# Altium schematic sheet ESP32.SchDoc: ESP32
size A4; Date: 12/11/2026; Author: LuiS David Duque Cañas; SheetNumber: 3; SheetTotal: 3
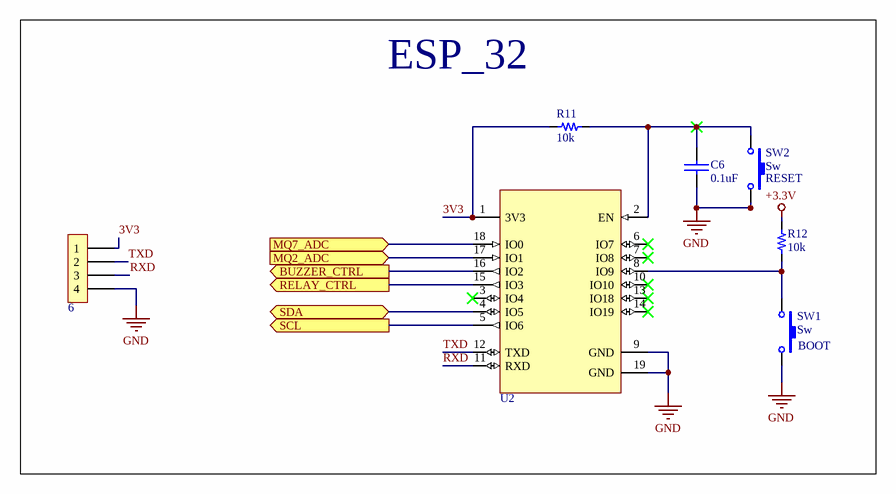
[diagram p0: ESP32.SchDoc]

## Parts
6  4x1  [H_4x1_TH_2.54mm]  (value not drawn)  (no BOM)
C6  value 0.1uF  [0603_cap]  (hidden comment: 0.1uF 50V)
R11  value 10k  [0603_res]  (hidden comment: 10k 1/10W)
R12  value 10k  [0603_res]  (hidden comment: 10k 1/10W)
SW1  Sw  [Sw_PUSH_4.5x4.5x5mm]
SW2  Sw  [Sw_PUSH_4.5x4.5x5mm]
U2  ESP32-C3-WROOM-02-N4  [ESP32-C3-WROOM-02-N4]  (value not drawn)

## Ports
BUZZER_CTRL (out, see Main[2B], Air-Quality[3B]), MQ2_ADC (in, see Main[2B], Air-Quality[2C]), MQ7_ADC (in, see Main[2B], Air-Quality[1C]), RELAY_CTRL (out, see Main[2C], Air-Quality[4C]), SCL (out, see Main[2B], Air-Quality[3D]), SDA (bidir, see Main[2B], Air-Quality[3D])

## Nets
+3.3V: R12.2
GND: 6.4 C6.2 SW1.2 SW2.2 U2.9(GND) U2.19(GND)
3V3: 6.1 R11.1 U2.1(3V3)
BUZZER_CTRL: U2.16(IO2) ; port BUZZER_CTRL
MQ2_ADC: U2.17(IO1) ; port MQ2_ADC
MQ7_ADC: U2.18(IO0) ; port MQ7_ADC
RELAY_CTRL: U2.15(IO3) ; port RELAY_CTRL
RXD: 6.3 U2.11(RXD)
SCL: U2.5(IO6) ; port SCL
SDA: U2.4(IO5) ; port SDA
TXD: 6.2 U2.12(TXD)
NetC6_1: C6.1 R11.2 SW2.1 U2.2(EN)
NetR12_1: R12.1 SW1.1 U2.8(IO9)

Not connected (* = marked no-connect by the designer): U2 3(IO4)* 6(IO7)* 7(IO8)* 10(IO10)* 13(IO18)* 14(IO19)*

## Notes on the sheet
- ESP_32
- (near SW2) RESET
- (near SW1) BOOT

## Library data of the parts
6 = H_Male_4x1_TH_100mil: ComponentLink1Description: LCSC
C6 = Cap_0.1uF_0603_50V: 50V 100nF Y5V -20%~+80% 0603 Multilayer Ceramic Capacitors MLCC - SMD/SMT ROHS; Manufacturer: Walsin Tech Corp; Manufacturer Part Number: 0603F104Z500CT; Supplier 1: LCSC; Supplier Part Number 1: C83060; ComponentLink1Description: LCSC; ComponentLink1URL: https://www.lcsc.com/product-detail/Multilayer-Ceramic-Capacitors-MLCC-SMD-SMT_Walsin-Tech-Corp-0603F104Z500CT_C83060.html
R11 R12 = Res_10k_0603_1/10W: RES SMD 10k OHM 5% 1/10W 0603; Manufacturer: FOJAN; Manufacturer Part Number: FRC0603J103TS; ComponentLink1URL: https://www.lcsc.com/product-detail/Chip-Resistor-Surface-Mount_FOJAN-FRC0603J103TS_C2930027.html; Supplier 1: LCSC; Supplier Part Number 1: C2930027; ComponentLink1Description: LCSC
SW1 SW2 = Sw_PUSH_4.5x4.5x5.0xmm: SWITCH TACTILE SPST-NO 0.05A 12V; Manufacturer: BZCN; Manufacturer Part Number: TSC015A05026A; Supplier 1: LCSC; Supplier Part Number 1: C2888509; Last modified by: N-A.Potosi; Last modified date: 20190222; ComponentLink1Description: LCSC; ComponentLink1URL: https://www.lcsc.com/product-detail/Tactile-Switches_BZCN-TSC015A05026A_C2888509.html
U2 = MCU_ESP32-C3-WROOM-02-N4: RF TXRX MOD BT WIFI PCB TH SMD; Manufacturer: Espressif Systems; Manufacturer Part Number: ESP32-C3-WROOM-02-N4; Supplier 1: LCSC; Supplier Part Number 1: C2934560; ComponentLink1Description: LCSC; ComponentLink1URL: https://lcsc.com/product-detail/WiFi-Modules_Espressif-Systems-ESP32-C3-WROOM-02-N4_C2934560.html